# Altium project MCU.PrjPcb (part 3 of 3)

## Sheet SoC POWER SUPPLY.SchDoc
size A3; SheetNumber: 18; SheetTotal: 17
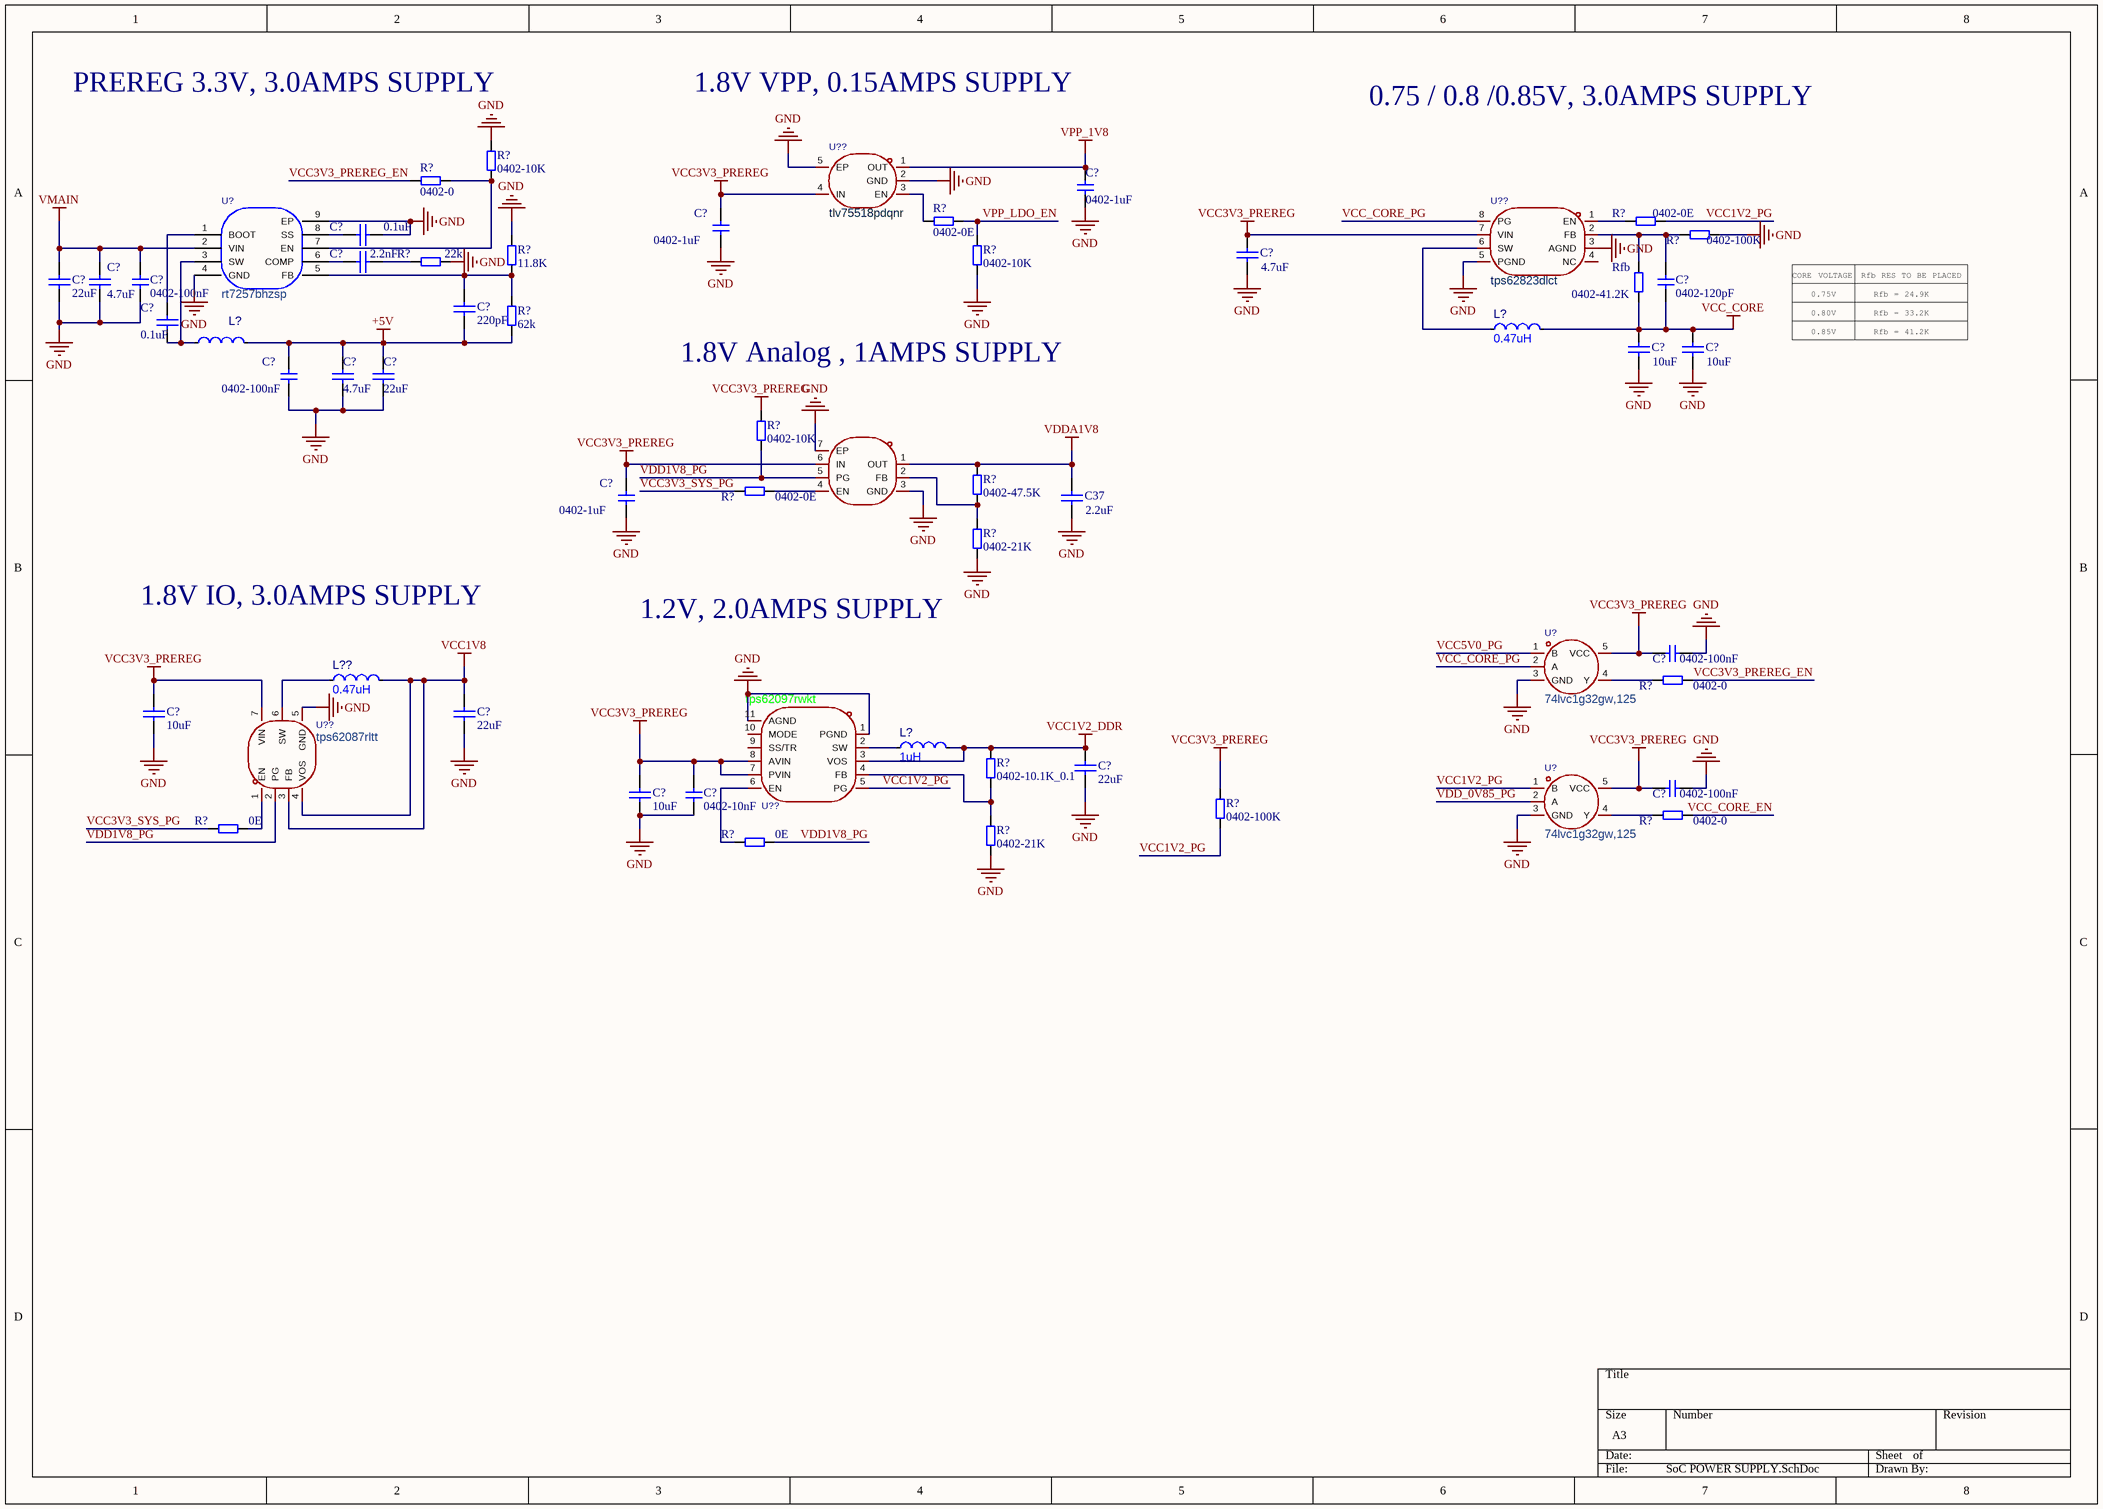
[diagram p13: SoC POWER SUPPLY.SchDoc]

### Parts
(Parts that share a designator on the sheet are numbered #1, #2 ... from top to bottom, then left to right.)
C37#2  2.2uF  [C0603]
C?#75  0402-1uF  [C0402]
C?#76  0.1uF  [C0603]
C?#77  0402-1uF  [C0402]
C?#78  2.2nF  [C0603]
C?#79  4.7uF  [C0603]
C?#80  0402-100nF  [C0402]
C?#81  0402-120pF  [C0402]
C?#82  22uF  [C0805]
C?#83  4.7uF  [C0603]
C?#84  220pF  [C0603]
C?#85  0.1uF  [C0603]
C?#86  10uF  [C0603]
C?#87  10uF  [C0603]
C?#88  0402-100nF  [C0402]
C?#89  4.7uF  [C0805]
C?#90  22uF  [C0805]
C?#91  0402-1uF  [C0402]
C?#92  0402-100nF  [C0402]
C?#93  10uF  [C0603]
C?#94  22uF  [C0805]
C?#95  22uF  [C0805]
C?#96  0402-100nF  [C0402]
C?#97  0402-10nF  [C0402]
C?#98  10uF  [C0603]
L?#3  0.47uH  [L0603]
L?#4  fxl0630-100-m  [IND-SMD_L7.3-W6.8]  (value not drawn)
L?#5  1uH  [L0603]
L??#2  0.47uH  [L0603]
R?#132  0402-0  [R0402]
R?#133  0402-10K  [R0402]
R?#134  0402-0E  [R0402]
R?#135  0402-0E  [R0402]
R?#136  0402-100K  [R0402]
R?#137  22k  [R0603]
R?#138  11.8K  [R0603]
R?#139  0402-10K  [R0402]
R?#140  62k  [R0603]
R?#141  0402-10K  [R0402]
R?#142  0402-0E  [R0402]
R?#143  0402-47.5K  [R0402]
R?#144  0402-21K  [R0402]
R?#145  0402-0  [R0402]
R?#146  0402-10.1K_0.1  [R0402]
R?#147  0402-0  [R0402]
R?#148  0E  [R0402]
R?#149  0402-100K  [R0402]
R?#150  0E  [R0402]
R?#151  0402-21K  [R0402]
Rfb  0402-41.2K  [R0402]
U?#8  rt7257bhzsp  [SOIC-8_L4.9-W3.9-P1.27-LS6.0-BL-EP2.3]
U?#9  74lvc1g32gw,125  [SOT-353_L2.2-W1.4-P0.65-LS2.4-BR]
U?#10  74lvc1g32gw,125  [SOT-353_L2.2-W1.4-P0.65-LS2.4-BR]
U??#6  tlv75518pdqnr  [X2SON-4_L1.0-W1.0-P0.65-TL-EP]
U??#7  tps62823dlct  [VSON-8_L2.0-W1.5-P0.50-BL]
U??#8  tps74601pdrvr  [WSON-6_L2.0-W2.0-P0.65-BL-EP]  (value not drawn)
U??#9  tps62087rltt  [VQFN-7_L2.0-W2.0-P0.50-TL_RLT0007A]
U??#10  tps62097rwkt  [VQFN-11_L2.0-W2.0-P0.50-TL_TI_RWK]

### Nets
+5V: C?#84.1 C?#88.1 C?#89.2 C?#90.2 L?#4.2 R?#140.1
GND: C37#2.1 C?#75.2 C?#76.1 C?#77.2 C?#79.1 C?#80.1 C?#80.2 C?#82.1 C?#82.2 C?#83.1 C?#83.2 C?#86.1 C?#87.1 C?#88.2 C?#89.1 C?#90.1 C?#91.2 C?#92.2 C?#93.1 C?#94.1 C?#95.1 C?#96.2 C?#97.2 C?#98.1 R?#133.2 R?#136.1 R?#137.2 R?#138.2 R?#139.1 R?#144.1 R?#151.1 U?#8.2(VIN) U?#8.4(GND) U?#8.9(EP) U?#9.3(GND) U?#10.3(GND) U??#6.2(GND) U??#6.5(EP) U??#7.3(AGND) U??#7.5(PGND) U??#8.3(GND) U??#8.7(EP) U??#9.5(GND) U??#10.1(PGND) U??#10.11(AGND)  [also labelled VMAIN]
VCC1V2_DDR: C?#95.2 L?#5.2 R?#146.2 U??#10.3(VOS)
VCC1V8: C?#94.2 L??#2.2 U??#9.3(FB) U??#9.4(VOS)
VCC3V3_PREREG: C?#77.1 C?#79.2 C?#91.1 C?#92.1 C?#93.2 C?#96.1 C?#97.1 C?#98.2 R?#141.2 R?#149.2 U?#9.5(VCC) U?#10.5(VCC) U??#6.4(IN) U??#7.7(VIN) U??#8.6(IN) U??#9.7(VIN) U??#10.7(PVIN) U??#10.8(AVIN)
VCC_CORE: C?#81.2 C?#86.2 C?#87.2 L?#3.2 Rfb.1
VDDA1V8: C37#2.2 R?#143.2 U??#8.1(OUT)
VPP_1V8: C?#75.1 U??#6.1(OUT)
VCC1V2_PG: R?#135.2 R?#149.1 U?#10.1(B) U??#10.5(PG)
VCC3V3_PREREG_EN: R?#132.2 R?#145.1
VCC3V3_SYS_PG: R?#142.2 R?#148.2
VCC5V0_PG: U?#9.1(B)
VCC_CORE_EN: R?#147.1
VCC_CORE_PG: U?#9.2(A) U??#7.8(PG)
VDD1V8_PG: R?#141.1 R?#150.1 U??#8.5(PG) U??#9.2(PG)
VDD_0V85_PG: U?#10.2(A)
VPP_LDO_EN: R?#134.2 R?#139.2
NetC?#76_2: C?#76.2 U?#8.8(SS)
NetC?#78_1: C?#78.1 R?#137.1
NetC?#78_2: C?#78.2 U?#8.6(COMP)
NetC?#81_1: C?#81.1 R?#136.2 Rfb.2 U??#7.2(FB)
NetC?#84_2: C?#84.2 R?#138.1 R?#140.2 U?#8.5(FB)
NetC?#85_1: C?#85.1 L?#4.1 U?#8.3(SW)
NetC?#85_2: C?#85.2 U?#8.1(BOOT)
NetL?#3_1: L?#3.1 U??#7.6(SW)
NetL?#5_1: L?#5.1 U??#10.2(SW)
NetL??#2_1: L??#2.1 U??#9.6(SW)
NetR?#132_1: R?#132.1 R?#133.1 U?#8.7(EN)
NetR?#134_1: R?#134.1 U??#6.3(EN)
NetR?#135_1: R?#135.1 U??#7.1(EN)
NetR?#142_1: R?#142.1 U??#8.4(EN)
NetR?#143_1: R?#143.1 R?#144.2 U??#8.2(FB)
NetR?#145_2: R?#145.2 U?#9.4(Y)
NetR?#146_1: R?#146.1 R?#151.2 U??#10.4(FB)
NetR?#147_2: R?#147.2 U?#10.4(Y)
NetR?#148_1: R?#148.1 U??#9.1(EN)
NetR?#150_2: R?#150.2 U??#10.6(EN)

Not connected (* = marked no-connect by the designer): U??#7 4(NC); U??#10 9(SS/TR) 10(MODE)

### Notes on the sheet
- PREREG 3.3V, 3.0AMPS SUPPLY
- 1.8V VPP, 0.15AMPS SUPPLY
- 0.75 / 0.8 /0.85V, 3.0AMPS SUPPLY
- (near R?#141) 1.8V Analog , 1AMPS SUPPLY
- 1.8V IO, 3.0AMPS SUPPLY
- 1.2V, 2.0AMPS SUPPLY

### Library data of the parts
C37#2 C?#79 C?#86 C?#87 = C0603_1: Capacitor; Value: 104; Published: 8-Jun-2000; LatestRevisionDate: 17-Jul-2002; LatestRevisionNote: Re-released for DXP Platform.; Publisher: Altium Limited
C?#75 C?#77 C?#80 C?#81 C?#88 C?#91 C?#92 C?#96 C?#97 = C0402: 物料号: *; 物料描述: *
C?#76 C?#78 C?#83-C?#85 C?#93 C?#98 = C0603: Capacitor; Value: 104; Published: 8-Jun-2000; LatestRevisionDate: 17-Jul-2002; LatestRevisionNote: Re-released for DXP Platform.; Publisher: Altium Limited
C?#82 C?#89 C?#90 C?#94 C?#95 = C0805: Capacitor; Value: 104; Published: 8-Jun-2000; LatestRevisionDate: 17-Jul-2002; LatestRevisionNote: Re-released for DXP Platform.; Publisher: Altium Limited
L?#3 L??#2 = L0603: 小型化一体成型T-CORE，小体积，扁线工艺，感值小，0.47uH ±20% 8.6A 1008​ PCT252012-R47-M; Manufacturer: Sunlord(顺络); Symbol: SDFL1608S100KTF; AddInBom: yes; ModelId: 2bc5ec593d464d6ba9807aec0b5673c2; ModelName: L0603_L1.6-W0.8-H0.5_BEAD; ModelTransform: 62.992,31.496,0,180,0,0,0.094,0.629,0; Value: 10uH; Tolerance: ±10%; Current Rating: 3mA; DC Resistance(DCR): 1.85Ω; Q @ Frequency: 30@2MHz; Frequency - Self Resonant: 17MHz; LCSC Part Name: 10uH ±10%; SupplierPart: C1035; ManufacturerPart: SDFL1608S100KTF; Supplier Footprint: 0603; JLCPCB Part Class: Basic Part; Datasheet: https://item.szlcsc.com/datasheet/SDFL1608S100KTF/1387.html; Supplier: LCSC; ConvertToPcb: yes; FootprintName: L0603; Current - Saturation (Isat): -; Ratings: -
L?#4 = fxl0630-100-m: 电感值:6.8uH;精度:±20%;额定电流:4.5A;饱和电流(Isat):5.5A;类型:一体成型电感;; Manufacturer: cjiang(长江微电); AddInBom: yes; ModelId: e28854526ca747668ea12fbe1dd39a63; ModelName: IND-SMD_L7.3-W6.8-H3.0; ModelTransform: 292.125,267.716,0,0,0,0,0,0,0; Value: 10uH; Tolerance: ±20%; Current Rating: 4.5A; Current - Saturation(Isat): 5.5A; DC Resistance(DCR): 68mΩ; Type: 一体成型电感; Symbol: FXL0630-100-M; LCSC Part Name: 10uH ±20% 5.5A; SupplierPart: C167223; ManufacturerPart: FXL0630-100-M; Supplier Footprint: SMD,7x6.6mm; JLCPCB Part Class: Extended Part; Datasheet: https://item.szlcsc.com/datasheet/FXL0630-100-M/178606.html; Supplier: LCSC; ConvertToPcb: yes; FootprintName: IND-SMD_L7.3-W6.8; Ratings: -
L?#5 = L0603: 小型化一体成型T-CORE，小体积，扁线工艺，感值小，1210​ 1uH ±20% 6A PCT322510-1R0-M; Manufacturer: Sunlord(顺络); Symbol: SDFL1608S100KTF; AddInBom: yes; ModelId: 2bc5ec593d464d6ba9807aec0b5673c2; ModelName: L0603_L1.6-W0.8-H0.5_BEAD; ModelTransform: 62.992,31.496,0,180,0,0,0.094,0.629,0; Value: 10uH; Tolerance: ±10%; Current Rating: 3mA; DC Resistance(DCR): 1.85Ω; Q @ Frequency: 30@2MHz; Frequency - Self Resonant: 17MHz; LCSC Part Name: 10uH ±10%; SupplierPart: C1035; ManufacturerPart: SDFL1608S100KTF; Supplier Footprint: 0603; JLCPCB Part Class: Basic Part; Datasheet: https://item.szlcsc.com/datasheet/SDFL1608S100KTF/1387.html; Supplier: LCSC; ConvertToPcb: yes; FootprintName: L0603; Current - Saturation (Isat): -; Ratings: -
R?#132-R?#136 R?#139 R?#141-R?#151 Rfb = R0402: 片式电阻; 物料描述: 片式电阻器-0805-10KΩ-5%-JT; 物料号: NA
R?#137 R?#138 R?#140 = 0603-3KΩ-5%: 片式电阻; 物料描述: 片式电阻器-0805-10KΩ-5%-JT; 物料号: NA
U?#8 = rt7257bhzsp: 功能类型:降压型;工作电压:4.5V~18V;输出电压:800mV~12V;输出电流:3A;输出类型:可调;; Manufacturer: RICHTEK(立锜); AddInBom: yes; ModelId: ba240e69e1f440f79b85bd6e5ae1d4fa; ModelTransform: 192.913,236.22,0,0,0,0,0,0,0; Function: 降压型; Output Current: 3A; Frequency - Switching: 1.2MHz; Synchronous Rectifier: 是; Number of Outputs: 1; Topology: 降压式; Quiescent Current: 800uA; Switch tube (built-in/external): 内置; Output Type: 可调; Symbol: RT7257BHZSP; LCSC Part Name: 降压型 3A 4.5V~18V; SupplierPart: C27998; ManufacturerPart: RT7257BHZSP; Supplier Footprint: SOIC-8-EP; JLCPCB Part Class: Extended Part; Datasheet: https://item.szlcsc.com/datasheet/RT7257BHZSP/28748.html; Supplier: LCSC; ConvertToPcb: yes; FootprintName: SOIC-8_L4.9-W3.9-P1.27-LS6.0-BL-EP2.3; ModelName: SOIC-8_L4.9-W3.9-P1.27-LS6.0-BL-EP2.3; Voltage - Supply: 4.5V~18V; Output Voltage: 800mV~12V; Operating Temperature: -40℃~+125℃@(TJ); Features: 外部补偿；逐波限流；可调软启动；过流保护；负载断开；打嗝限流；保护锁死
U?#9 U?#10 = 74lvc1g32gw,125: 逻辑类型:或门;门电路数量:1;工作电压:1.65V~5.5V;静态电流(Iq):4uA;传播延迟(tpd):4ns@5V,50pF;; Manufacturer: Nexperia(安世); AddInBom: yes; ModelId: 4e853f80e521480faffa12d625b9ef27; ModelName: SOT-353-5P_L2.0-W1.3-H1.1-LS2.0-P0.65; ModelTransform: 83.17133,78.74,0,180,0,0,0,0,0; Logic Type: 或门; Number of Gates: 1; Quiescent Current: 4uA; Current - Output Low(IOL): 32mA; Input Logic Level - High: 1.7V~2V; Input Logic Level - Low: 700mV~800mV; Output Logic Level - High: 3.4V；2V; Output Logic Level - Low: 800mV; Inputs per Gates: 2; Input type: 施密特触发器; Symbol: 74LVC1G32GW,125; LCSC Part Name: 单路二输入或门; SupplierPart: C12516; ManufacturerPart: 74LVC1G32GW,125; Supplier Footprint: SOT-353; JLCPCB Part Class: Extended Part; Datasheet: https://item.szlcsc.com/datasheet/74LVC1G32GW%252C125/13150.html; Supplier: LCSC; ConvertToPcb: yes; FootprintName: SOT-353_L2.2-W1.4-P0.65-LS2.4-BR; Voltage - Supply: 1.65V~5.5V; Current - Output High(IOH): 32mA; Series: 74LVC系列; Propagation Delay: 4ns@5V,50pF; Operating Temperature: -40℃~+125℃; Features: 局部关断模式；过压容忍输入; output type: -
U??#6 = tlv75518pdqnr: 输出极性:正极;工作电压:5.5V;输出电压:1.8V;输出电流:500mA;电源纹波抑制比(PSRR):46dB@(100kHz);输出类型:固定;; Manufacturer: TI(德州仪器); AddInBom: yes; ModelId: a553ba60275546fca9968967ae1dc97f; ModelName: X2SON-4_L1.0-W1.0-H0.4-P0.65-TL-EPSLDPRT; ModelTransform: 40.1574,40.1574,0,90,0,0,-0.001,-0.001,0; Output Configuration: 正极; Voltage - Supply: 5.5V; Output Voltage: 1.8V; Output Current: 500mA; Voltage Dropout: 238mV@(500mA); standby current: 33uA; Noise: 71.5uVrms; Output Type: 固定; Number of Outputs: 1; Symbol: TLV75518PDQNR; LCSC Part Name: 1.8V 500mA 5.5V; SupplierPart: C2867154; ManufacturerPart: TLV75518PDQNR; Supplier Footprint: X2-SON-4-EP(1x1); JLCPCB Part Class: Extended Part; Datasheet: https://www.ti.com/cn/lit/ds/symlink/tlv755p.pdf; Supplier: LCSC; ConvertToPcb: yes; FootprintName: X2SON-4_L1.0-W1.0-P0.65-TL-EP; Power Supply Rejection Ratio (PSRR): 46dB@(100kHz); Features: 内置软启动；使能控制；短路保护；过流保护；输出放电；热关断；输入欠压保护; Operating Temperature: -40℃~+125℃@(Tj)
U??#7 = tps62823dlct: 功能类型:降压型;工作电压:2.4V~5.5V;输出电压:600mV~4V;输出电流:3A;输出类型:可调;; Manufacturer: TI(德州仪器); AddInBom: yes; ModelId: 875e547f9a24421682681603838b91fb; ModelName: VSON-8_L2.0-W1.5-H1.0-P0.50-BL; ModelTransform: 59.8424,78.74,0,270,0,0,0,0,0; Function: 降压型; Output Current: 3A; Frequency - Switching: 2.2MHz; Synchronous Rectifier: 是; Number of Outputs: 1; Topology: 降压式; Quiescent Current: 4uA; Switch tube (built-in/external): 内置; Output Type: 可调; Symbol: TPS62823DLCT; LCSC Part Name: 降压型 3A 2.4V~5.5V; SupplierPart: C2072030; ManufacturerPart: TPS62823DLCT; Supplier Footprint: VSON-8(1.5x2); JLCPCB Part Class: Extended Part; Datasheet: https://www.ti.com/cn/lit/ds/symlink/tps62821.pdf; Supplier: LCSC; ConvertToPcb: yes; FootprintName: VSON-8_L2.0-W1.5-P0.50-BL; Voltage - Supply: 2.4V~5.5V; Output Voltage: 600mV~4V; Operating Temperature: -40℃~+125℃@(TJ); Features: 轻载高效模式；逐波限流；过流保护；输出放电；工作状态指示；打嗝限流
U??#8 = tps74601pdrvr: 输出极性:正极;工作电压:6V;输出电压:550mV~5.5V;输出电流:1A;电源纹波抑制比(PSRR):50dB@(1kHz);输出类型:可调;; Manufacturer: TI(德州仪器); AddInBom: yes; ModelId: 521c6d8f59ad4736925338f4a59f8ef4; ModelName: WSON-6_L2.0-W2.0-H0.8-P0.65; ModelTransform: 79.527,78.74,0,90,0,0,-0.002,-0.002,0; Output Configuration: 正极; Voltage - Supply: 6V; Output Current: 1A; Voltage Dropout: 225mV@(1A); standby current: 25uA; Noise: 53uVrms; Output Type: 可调; Number of Outputs: 1; Symbol: TPS74601PDRVR; LCSC Part Name: 550mV~5.5V 1A 6V; SupplierPart: C2837407; ManufacturerPart: TPS74601PDRVR; Supplier Footprint: WSON-6-EP(2x2); JLCPCB Part Class: Extended Part; Datasheet: https://www.ti.com/cn/lit/ds/symlink/tps746.pdf; Supplier: LCSC; ConvertToPcb: yes; FootprintName: WSON-6_L2.0-W2.0-P0.65-BL-EP; Output Voltage: 550mV~5.5V; Power Supply Rejection Ratio (PSRR): 50dB@(1kHz); Features: 内置软启动；工作状态指示；输入欠压保护；使能控制；过流保护；短路保护；输出放电；热关断; Operating Temperature: -40℃~+125℃@(Tj)
U??#9 = tps62087rltt: 功能类型:降压型;工作电压:2.5V~6V;输出电压:1.8V;输出电流:3A;输出类型:固定;; Manufacturer: TI(德州仪器); AddInBom: yes; ModelId: 82205d4ef1774f108fb3b3b48b26804a; ModelTransform: 78.819,78.74,0,0,0,0,8.501,-0.001,0; Function: 降压型; Output Voltage: 1.8V; Output Current: 3A; Frequency - Switching: 2.4MHz; Synchronous Rectifier: 是; Number of Outputs: 1; Topology: 降压式; Quiescent Current: 17uA; Switch tube (built-in/external): 内置; Output Type: 固定; Symbol: TPS62087RLTT; LCSC Part Name: 降压型 3A 2.5V~6V; SupplierPart: C2071697; ManufacturerPart: TPS62087RLTT; Supplier Footprint: VQFN-7(2x2); JLCPCB Part Class: Extended Part; Datasheet: https://www.ti.com/cn/lit/gpn/tps62086; Supplier: LCSC; ConvertToPcb: yes; FootprintName: VQFN-7_L2.0-W2.0-P0.50-TL_RLT0007A; ModelName: VQFN-7_L2.0-W2.0-P0.50-TL_RLT0007A; Voltage - Supply: 2.5V~6V; Operating Temperature: -40℃~+125℃@(TJ); Features: 轻载高效模式；输出放电；工作状态指示；打嗝限流
U??#10 = tps62097rwkt: 功能类型:降压型;工作电压:2.5V~6V;输出电压:800mV~6V;输出电流:2A;输出类型:可调;; Manufacturer: TI(德州仪器); AddInBom: yes; Function: 降压型; Output Current: 2A; Frequency - Switching: 2.5MHz; Synchronous Rectifier: 是; Number of Outputs: 1; Topology: 降压式; Quiescent Current: 57uA; Switch tube (built-in/external): 内置; Output Type: 可调; Symbol: TPS62097RWKT; LCSC Part Name: 降压型 2A 2.5V~6V; SupplierPart: C2073254; ManufacturerPart: TPS62097RWKT; Supplier Footprint: VQFN-11(2x2); JLCPCB Part Class: Extended Part; Datasheet: https://www.ti.com/cn/lit/gpn/tps62097; Supplier: LCSC; ConvertToPcb: yes; FootprintName: VQFN-11_L2.0-W2.0-P0.50-TL_TI_RWK; Voltage - Supply: 2.5V~6V; Output Voltage: 800mV~6V; Operating Temperature: -40℃~+125℃@(TJ); Features: 轻载高效模式；可调软启动；输出放电；输出电压跟随；工作状态指示；打嗝限流

## Sheet PERIPHERAL POWER SUPPLY.SchDoc
size A3; SheetNumber: 16; SheetTotal: 17
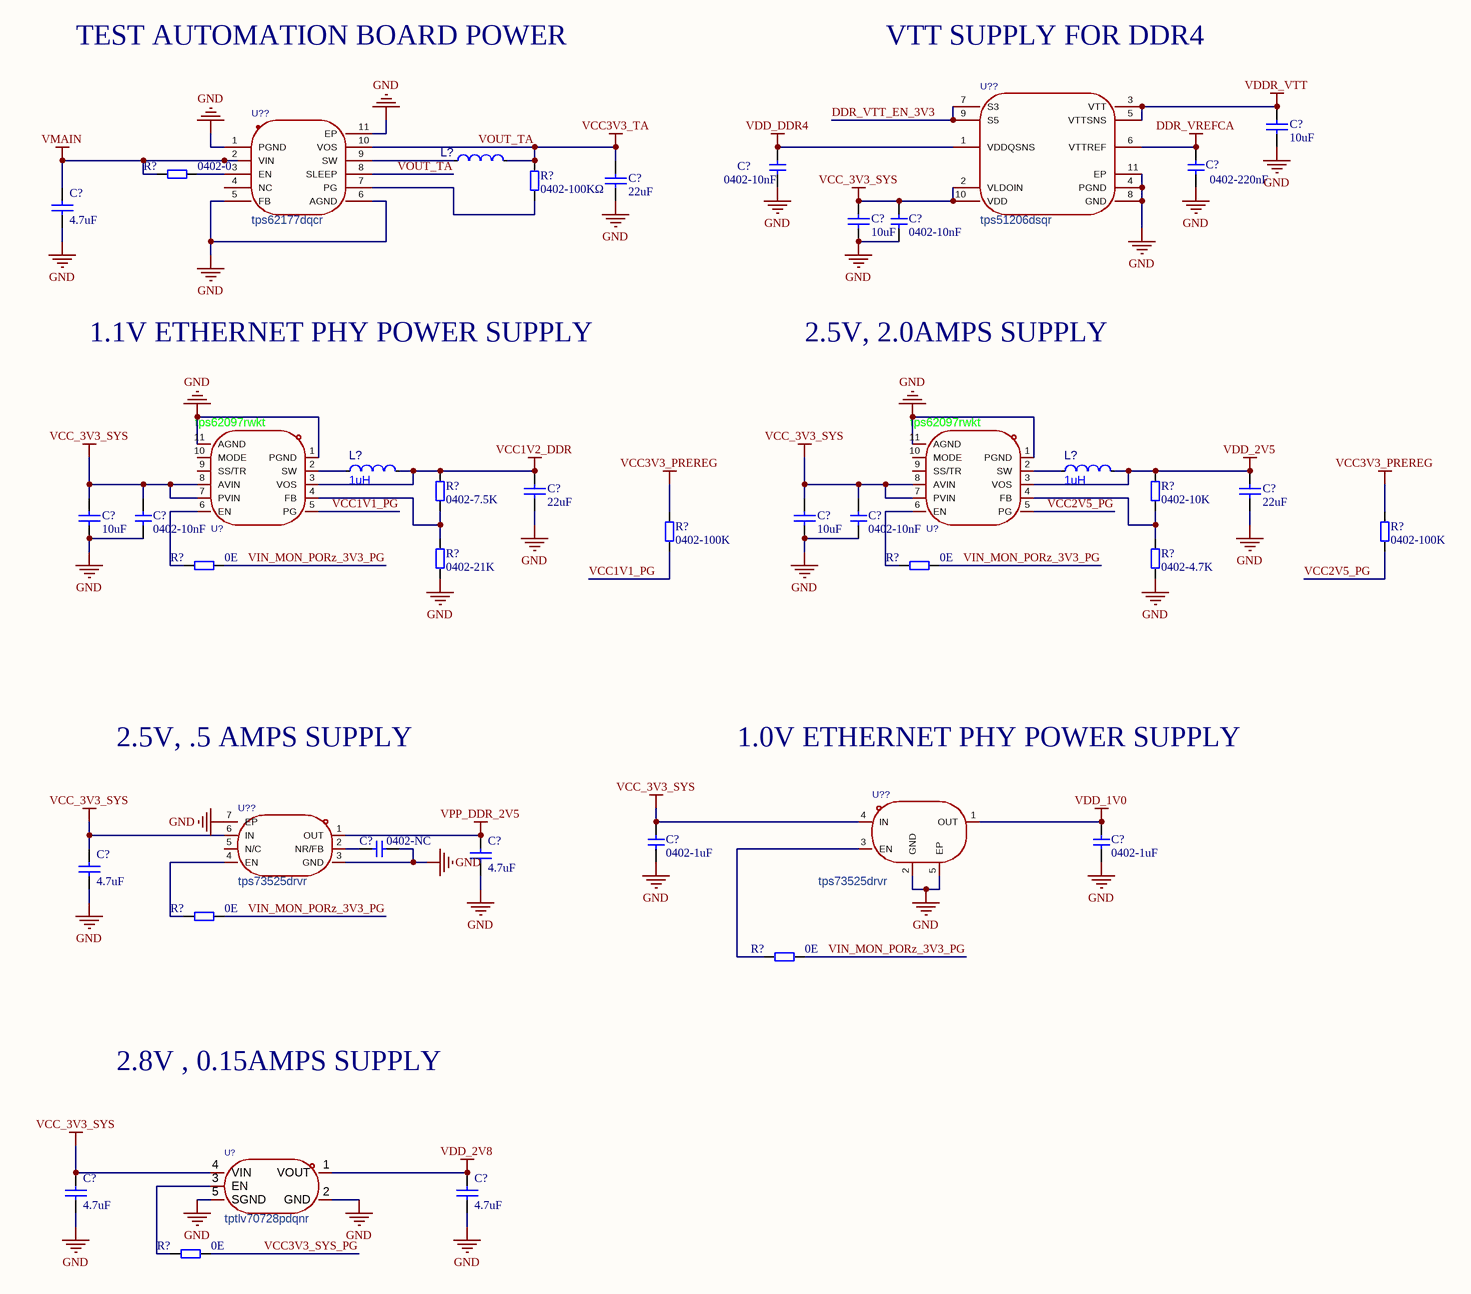
[diagram p14: PERIPHERAL POWER SUPPLY.SchDoc]

### Parts
(Parts that share a designator on the sheet are numbered #1, #2 ... from top to bottom, then left to right.)
C?#99  10uF  [C0603]
C?#100  0402-10nF  [C0402]
C?#101  0402-220nF  [C0402]
C?#102  22uF  [C0805]
C?#103  4.7uF  [C0603]
C?#104  0402-10nF  [C0402]
C?#105  10uF  [C0603]
C?#106  22uF  [C0805]
C?#107  22uF  [C0805]
C?#108  0402-10nF  [C0402]
C?#109  0402-10nF  [C0402]
C?#110  10uF  [C0603]
C?#111  10uF  [C0603]
C?#112  0402-1uF  [C0402]
C?#113  0402-1uF  [C0402]
C?#114  0402-NC  [C0402]
C?#115  4.7uF  [C0603]
C?#116  4.7uF  [C0603]
C?#117  4.7uF  [C0603]
C?#118  4.7uF  [C0603]
L?#6  fxl0630-100-m  [IND-SMD_L7.3-W6.8]  (value not drawn)
L?#7  1uH  [L0603]
L?#8  1uH  [L0603]
R?#152  0402-0  [R0402]
R?#153  0402-100KΩ  [R0402]
R?#154  0402-7.5K  [R0402]
R?#155  0402-10K  [R0402]
R?#156  0402-100K  [R0402]
R?#157  0402-100K  [R0402]
R?#158  0E  [R0402]
R?#159  0E  [R0402]
R?#160  0402-21K  [R0402]
R?#161  0402-4.7K  [R0402]
R?#162  0E  [R0402]
R?#163  0E  [R0402]
R?#164  0E  [R0402]
U?#11  tps62097rwkt  [VQFN-11_L2.0-W2.0-P0.50-TL_TI_RWK]
U?#12  tps62097rwkt  [VQFN-11_L2.0-W2.0-P0.50-TL_TI_RWK]
U?#13  tptlv70728pdqnr  [UDFN-4_L1.0-W1.0-P0.65-TL]
U??#11  tps51206dsqr  [SON-10_L2.0-W2.0-P0.40-TL-EP]
U??#12  tps62177dqcr  [WSON-10_L3.0-W2.0-P0.50-BL-EP]
U??#13  tps73525drvr  [WSON-6_L2.0-W2.0-P0.65-TL-EP]
U??#14  tps73525drvr  [WSON-6_L2.0-W2.0-P0.65-TL-EP]

### Nets
DDR_VREFCA: C?#101.1 U??#11.6(VTTREF)
GND: C?#99.1 C?#100.2 C?#101.2 C?#102.1 C?#103.1 C?#103.2 C?#104.2 C?#105.1 C?#106.1 C?#107.1 C?#108.2 C?#109.2 C?#110.1 C?#111.1 C?#112.2 C?#113.2 C?#114.2 C?#115.1 C?#116.1 C?#117.1 C?#118.1 R?#152.1 R?#160.1 R?#161.1 U?#11.1(PGND) U?#11.11(AGND) U?#12.1(PGND) U?#12.11(AGND) U?#13.2(GND) U?#13.5(SGND) U??#11.4(PGND) U??#11.8(GND) U??#11.11(EP) U??#12.1(PGND) U??#12.2(VIN) U??#12.5(FB) U??#12.6(AGND) U??#12.11(EP) U??#13.2(GND) U??#13.5(EP) U??#14.3(GND) U??#14.7(EP)  [also labelled VMAIN]
VCC1V2_DDR: C?#106.2 L?#7.2 R?#154.2 U?#11.3(VOS)
VCC3V3_PREREG: R?#156.2 R?#157.2
VCC_3V3_SYS: C?#104.1 C?#105.2 C?#108.1 C?#109.1 C?#110.2 C?#111.2 C?#112.1 C?#116.2 C?#117.2 U?#11.7(PVIN) U?#11.8(AVIN) U?#12.7(PVIN) U?#12.8(AVIN) U?#13.4(VIN) U??#11.2(VLDOIN) U??#11.10(VDD) U??#13.4(IN) U??#14.6(IN)
VDD_1V0: C?#113.1 U??#13.1(OUT)
VDD_2V5: C?#107.2 L?#8.2 R?#155.2 U?#12.3(VOS)
VDD_2V8: C?#118.2 U?#13.1(VOUT)
VDD_DDR4: C?#100.1 U??#11.1(VDDQSNS)
VDDR_VTT: C?#99.2 U??#11.3(VTT) U??#11.5(VTTSNS)
VOUT_TA: C?#102.2 L?#6.2 R?#153.2 U??#12.8(SLEEP) U??#12.10(VOS)  [also labelled VCC3V3_TA]
VPP_DDR_2V5: C?#115.2 U??#14.1(OUT)
DDR_VTT_EN_3V3: U??#11.7(S3) U??#11.9(S5)
VCC1V1_PG: R?#156.1 U?#11.5(PG)
VCC2V5_PG: R?#157.1 U?#12.5(PG)
VCC3V3_SYS_PG: R?#164.1
VIN_MON_PORz_3V3_PG: R?#158.1 R?#159.1 R?#162.1 R?#163.1
NetC?#114_1: C?#114.1 U??#14.2(NR/FB)
NetL?#6_1: L?#6.1 U??#12.9(SW)
NetL?#7_1: L?#7.1 U?#11.2(SW)
NetL?#8_1: L?#8.1 U?#12.2(SW)
NetR?#152_2: R?#152.2 U??#12.3(EN)
NetR?#153_1: R?#153.1 U??#12.7(PG)
NetR?#154_1: R?#154.1 R?#160.2 U?#11.4(FB)
NetR?#155_1: R?#155.1 R?#161.2 U?#12.4(FB)
NetR?#158_2: R?#158.2 U?#11.6(EN)
NetR?#159_2: R?#159.2 U?#12.6(EN)
NetR?#162_2: R?#162.2 U??#14.4(EN)
NetR?#163_2: R?#163.2 U??#13.3(EN)
NetR?#164_2: R?#164.2 U?#13.3(EN)

Not connected (* = marked no-connect by the designer): U?#11 9(SS/TR) 10(MODE); U?#12 9(SS/TR) 10(MODE); U??#12 4(NC); U??#14 5(N/C)

### Notes on the sheet
- TEST AUTOMATION BOARD POWER
- VTT SUPPLY FOR DDR4
- 1.1V ETHERNET PHY POWER SUPPLY
- 2.5V, 2.0AMPS SUPPLY
- 2.5V, .5 AMPS SUPPLY
- 1.0V ETHERNET PHY POWER SUPPLY
- 2.8V , 0.15AMPS SUPPLY

### Library data of the parts
C?#99 C?#103 C?#105 C?#110 C?#111 C?#115-C?#118 = C0603: Capacitor; Value: 104; Published: 8-Jun-2000; LatestRevisionDate: 17-Jul-2002; LatestRevisionNote: Re-released for DXP Platform.; Publisher: Altium Limited
C?#100 C?#101 C?#104 C?#108 C?#109 C?#112-C?#114 = C0402: 物料号: *; 物料描述: *
C?#102 C?#106 C?#107 = C0805: Capacitor; Value: 104; Published: 8-Jun-2000; LatestRevisionDate: 17-Jul-2002; LatestRevisionNote: Re-released for DXP Platform.; Publisher: Altium Limited
L?#6 = fxl0630-100-m: as L?#4 on sheet SoC POWER SUPPLY; Symbol: FXL0630-100-M; LCSC Part Name: 10uH ±20% 5.5A; SupplierPart: C167223; ManufacturerPart: FXL0630-100-M; Supplier Footprint: SMD,7x6.6mm; JLCPCB Part Class: Extended Part; Datasheet: https://item.szlcsc.com/datasheet/FXL0630-100-M/178606.html; Supplier: LCSC; ConvertToPcb: yes; FootprintName: IND-SMD_L7.3-W6.8; Ratings: -
L?#7 L?#8 = L0603: as L?#5 on sheet SoC POWER SUPPLY; LCSC Part Name: 10uH ±10%; SupplierPart: C1035; ManufacturerPart: SDFL1608S100KTF; Supplier Footprint: 0603; JLCPCB Part Class: Basic Part; Datasheet: https://item.szlcsc.com/datasheet/SDFL1608S100KTF/1387.html; Supplier: LCSC; ConvertToPcb: yes; FootprintName: L0603; Current - Saturation (Isat): -; Ratings: -
R?#152-R?#164 = R0402: as R?#132 on sheet SoC POWER SUPPLY
U?#11 U?#12 = tps62097rwkt: as U??#10 on sheet SoC POWER SUPPLY; Symbol: TPS62097RWKT; LCSC Part Name: 降压型 2A 2.5V~6V; SupplierPart: C2073254; ManufacturerPart: TPS62097RWKT; Supplier Footprint: VQFN-11(2x2); JLCPCB Part Class: Extended Part; Datasheet: https://www.ti.com/cn/lit/gpn/tps62097; Supplier: LCSC; ConvertToPcb: yes; FootprintName: VQFN-11_L2.0-W2.0-P0.50-TL_TI_RWK; Voltage - Supply: 2.5V~6V; Output Voltage: 800mV~6V; Operating Temperature: -40℃~+125℃@(TJ); Features: 轻载高效模式；可调软启动；输出放电；输出电压跟随；工作状态指示；打嗝限流
U?#13 = tptlv70728pdqnr: Manufacturer: TECH PUBLIC(台舟); AddInBom: yes; ModelId: 9c2eebc267f642aab45e7193d1ab7813; ModelTransform: 40.1574,39.37394,0,0,0,0,0,0,0; LCSC Part Name: TPTLV70728PDQNR; SupplierPart: C55191407; ManufacturerPart: TPTLV70728PDQNR; Supplier Footprint: DFN-4(1x1); JLCPCB Part Class: Extended Part; Datasheet: https://item.szlcsc.com/datasheet/TPTLV70728PDQNR/58985584.html; Supplier: LCSC; ConvertToPcb: yes; SymbolName: TPTLV70728PDQNR; FootprintName: UDFN-4_L1.0-W1.0-P0.65-TL; ModelName: UDFN-4_L1.0-W1.0-P0.65-TL
U??#11 = tps51206dsqr: 输出极性:正极;工作电压:6.5V;输出电压:500mV~900mV;输出电流:2A;电源纹波抑制比(PSRR):-;输出类型:-;; Manufacturer: TI(德州仪器); AddInBom: yes; ModelId: 67ee0328d4a549d7a6ffbda5a640ba02; ModelName: SON-10_L2.0-W2.0-H0.9-P0.40-TL-EP; ModelTransform: 78.74,79.527,0,270,0,0,0,0,0; Output Configuration: 正极; Voltage - Supply: 6.5V; Output Current: 2A; standby current: 170uA; Number of Outputs: 2; Symbol: TPS51206DSQR; LCSC Part Name: 500mV~900mV 2A 6.5V; SupplierPart: C88038; ManufacturerPart: TPS51206DSQR; Supplier Footprint: SON-10-EP(2x2); JLCPCB Part Class: Extended Part; Datasheet: https://www.ti.com/cn/lit/ds/symlink/tps51206.pdf; Supplier: LCSC; ConvertToPcb: yes; FootprintName: SON-10_L2.0-W2.0-P0.40-TL-EP; Output Voltage: 500mV~900mV; Power Supply Rejection Ratio (PSRR): -; Voltage Dropout: -; Noise: -; Features: 输入欠压保护；输出放电；热关断; Operating Temperature: -40℃~+85℃; Output Type: -
U??#12 = tps62177dqcr: 功能类型:降压型;工作电压:4.75V~28V;输出电压:3.3V;输出电流:500mA;输出类型:固定;; Manufacturer: TI(德州仪器); AddInBom: yes; ModelId: 31d7ab64162b448781b010e9f8706f97; ModelName: WSON-10_L3.0-W2.0-H0.8-P0.50; ModelTransform: 79.527,118.11,0,90,0,0,0,0,0; Function: 降压型; Output Voltage: 3.3V; Output Current: 500mA; Frequency - Switching: 1MHz; Synchronous Rectifier: 是; Number of Outputs: 1; Topology: 降压式; Quiescent Current: 22uA; Switch tube (built-in/external): 内置; Output Type: 固定; Symbol: TPS62177DQCR; LCSC Part Name: 降压型 500mA 4.75V~28V; SupplierPart: C91241; ManufacturerPart: TPS62177DQCR; Supplier Footprint: WSON-10-EP(2x3); JLCPCB Part Class: Extended Part; Datasheet: https://www.ti.com/cn/lit/ds/symlink/tps62177.pdf; Supplier: LCSC; ConvertToPcb: yes; FootprintName: WSON-10_L3.0-W2.0-P0.50-BL-EP; Voltage - Supply: 4.75V~28V; Operating Temperature: -40℃~+125℃@(TJ); Features: 轻载高效模式；过流保护；输出放电；工作状态指示
U??#13 = TLV70710DQNR: 输出极性:正极;工作电压:6.5V;输出电压:2.5V;输出电流:500mA;电源纹波抑制比(PSRR):68dB@(1kHz);输出类型:固定;; Manufacturer: TI(德州仪器); AddInBom: yes; ModelId: 521c6d8f59ad4736925338f4a59f8ef4; ModelName: WSON-6_L2.0-W2.0-H0.8-P0.65; ModelTransform: 79.527,78.74,0,0,0,0,0,0,0; Output Configuration: 正极; Voltage - Supply: 6.5V; Output Voltage: 2.5V; Output Current: 500mA; Voltage Dropout: 280mV@(500mA); standby current: 45uA; Noise: 13.2uVrms; Output Type: 固定; Number of Outputs: 1; Symbol: TPS73525DRVR; LCSC Part Name: 500mA 6.5V; SupplierPart: C2870409; ManufacturerPart: TPS73525DRVR; Supplier Footprint: WSON-6-EP(2x2); JLCPCB Part Class: Extended Part; Datasheet: https://www.ti.com/cn/lit/ds/symlink/tps735.pdf; Supplier: LCSC; ConvertToPcb: yes; FootprintName: WSON-6_L2.0-W2.0-P0.65-TL-EP; Power Supply Rejection Ratio (PSRR): 68dB@(1kHz); Features: 使能控制；输入欠压保护；噪声旁路端子；过流保护；热关断; Operating Temperature: -40℃~+125℃@(Tj)
U??#14 = tps73525drvr: 输出极性:正极;工作电压:6.5V;输出电压:2.5V;输出电流:500mA;电源纹波抑制比(PSRR):68dB@(1kHz);输出类型:固定;; Manufacturer: TI(德州仪器); AddInBom: yes; ModelId: 521c6d8f59ad4736925338f4a59f8ef4; ModelName: WSON-6_L2.0-W2.0-H0.8-P0.65; ModelTransform: 79.527,78.74,0,0,0,0,0,0,0; Output Configuration: 正极; Voltage - Supply: 6.5V; Output Voltage: 2.5V; Output Current: 500mA; Voltage Dropout: 280mV@(500mA); standby current: 45uA; Noise: 13.2uVrms; Output Type: 固定; Number of Outputs: 1; Symbol: TPS73525DRVR; LCSC Part Name: 500mA 6.5V; SupplierPart: C2870409; ManufacturerPart: TPS73525DRVR; Supplier Footprint: WSON-6-EP(2x2); JLCPCB Part Class: Extended Part; Datasheet: https://www.ti.com/cn/lit/ds/symlink/tps735.pdf; Supplier: LCSC; ConvertToPcb: yes; FootprintName: WSON-6_L2.0-W2.0-P0.65-TL-EP; Power Supply Rejection Ratio (PSRR): 68dB@(1kHz); Features: 使能控制；输入欠压保护；噪声旁路端子；过流保护；热关断; Operating Temperature: -40℃~+125℃@(Tj)

## Sheet VCC3V3_SYS & VCC_5V0 POWER SUPPLY.SchDoc: AM2434 - 3V3 / 5V main supplies
size A4; Date: 2026-10-16; Revision: PWR-A; SheetNumber: 16; SheetTotal: 17
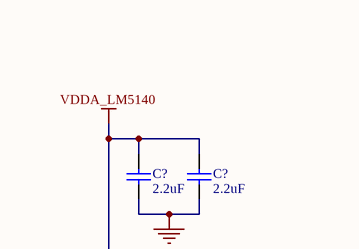
[diagram p15: VCC3V3_SYS & VCC_5V0 POWER SUPPLY.SchDoc, top left]
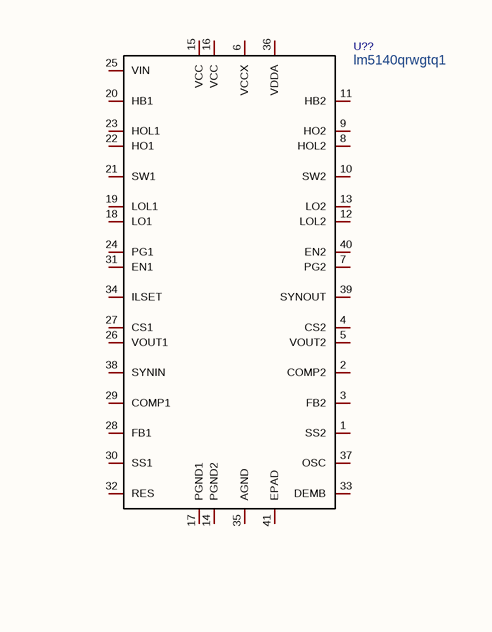
[diagram p16: VCC3V3_SYS & VCC_5V0 POWER SUPPLY.SchDoc, top right]
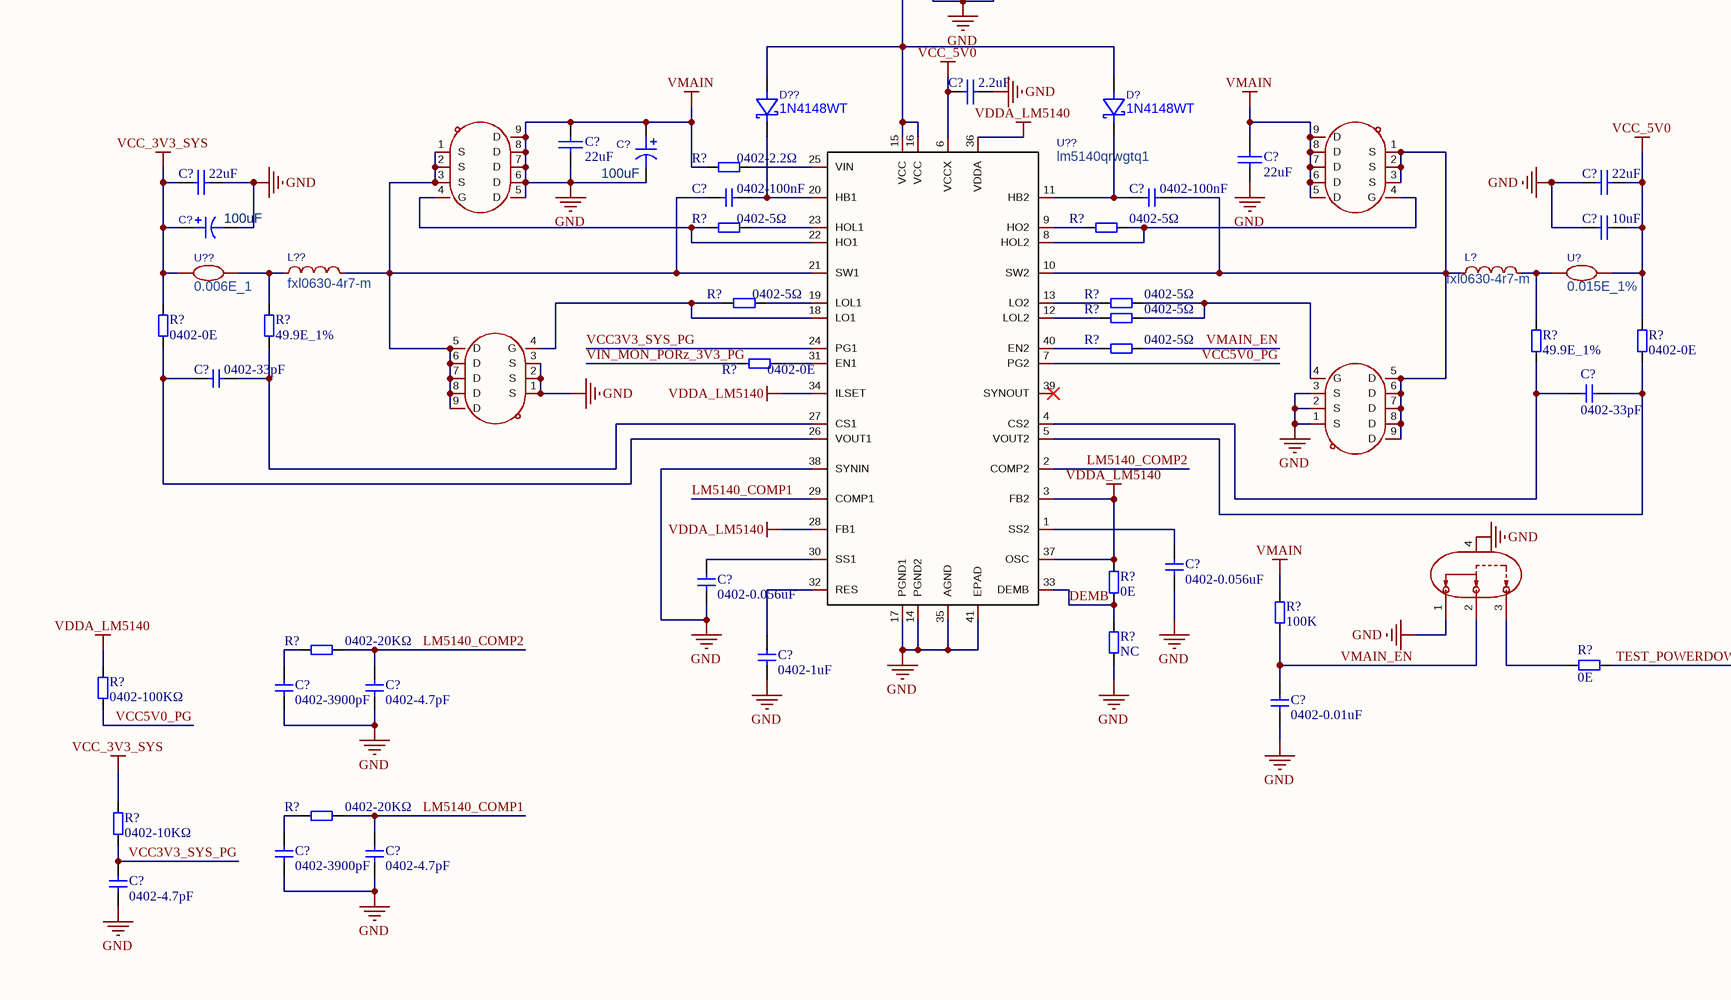
[diagram p17: VCC3V3_SYS & VCC_5V0 POWER SUPPLY.SchDoc, bottom left]
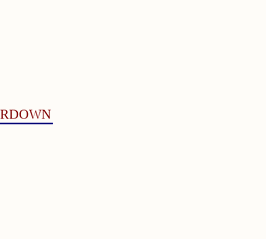
[diagram p18: VCC3V3_SYS & VCC_5V0 POWER SUPPLY.SchDoc, bottom right]

### Parts
(Parts that share a designator on the sheet are numbered #1, #2 ... from top to bottom, then left to right.)
C?#119  2.2uF  [C0603]
C?#120  2.2uF  [C0603]
C?#121  2.2uF  [C0603]
C?#122  22uF  [C0805]
C?#123  100uF  [CAP-SMD_BD6.3-L6.6-W6.6-RD]
C?#124  22uF  [C0805]
C?#125  22uF  [C0805]
C?#126  0402-100nF  [C0402]
C?#127  0402-100nF  [C0402]
C?#128  22uF  [C0805]
C?#129  100uF  [CAP-SMD_BD6.3-L6.6-W6.6-RD]
C?#130  10uF  [C0805]
C?#131  0402-33pF  [C0402]
C?#132  0402-33pF  [C0402]
C?#133  0402-0.056uF  [C0402]
C?#134  0402-0.056uF  [C0402]
C?#135  0402-1uF  [C0402]
C?#136  0402-3900pF  [C0402]
C?#137  0402-4.7pF  [C0402]
C?#138  0402-0.01uF  [C0402]
C?#139  0402-3900pF  [C0402]
C?#140  0402-4.7pF  [C0402]
C?#141  0402-4.7pF  [C0402]
D?#14  1N4148WT  [SOD-523_L1.2-W0.8-LS1.6-FD]
D??  1N4148WT  [SOD-523_L1.2-W0.8-LS1.6-FD]
L?#9  fxl0630-4r7-m  [IND-SMD_L7.0-W6.6]
L??#3  fxl0630-4r7-m  [IND-SMD_L7.0-W6.6]
Q?#3  csd18543q3a  [VSONP-8_L3.1-W3.1-P0.65-LS3.5-BL]  (value not drawn)
Q?#4  csd18543q3a  [VSONP-8_L3.1-W3.1-P0.65-LS3.5-BL]  (value not drawn)
Q??#2  csd18543q3a  [VSONP-8_L3.1-W3.1-P0.65-LS3.5-BL]  (value not drawn)
Q??#3  csd18543q3a  [VSONP-8_L3.1-W3.1-P0.65-LS3.5-BL]  (value not drawn)
R?#165  0402-2.2Ω  [R0402]
R?#166  0402-5Ω  [R0402]
R?#167  0402-5Ω  [R0402]
R?#168  0402-5Ω  [R0402]
R?#169  0402-5Ω  [R0402]
R?#170  0402-5Ω  [R0402]
R?#171  0402-0E  [R0402]
R?#172  49.9E_1%  [R0402]
R?#173  0402-5Ω  [R0402]
R?#174  0402-0E  [R0402]
R?#175  49.9E_1%  [R0402]
R?#176  0402-0E  [R0402]
R?#177  0E  [R0402]
R?#178  100K  [R0402]
R?#179  0402-20KΩ  [R0402]
R?#180  NC  [R0402]
R?#181  0E  [R0402]
R?#182  0402-100KΩ  [R0402]
R?#183  0402-20KΩ  [R0402]
R?#184  0402-10KΩ  [R0402]
U?#14  0.015E_1%  [R1206]
U??#15  lm5140qrwgtq1  [VQFN-40_L6.0-W6.0-P0.50-BL-EP]
U??#16  0.006E_1  [R1206]
U??#17  lm5140qrwgtq1  [VQFN-40_L6.0-W6.0-P0.50-BL-EP]
U??#18  mss12c02ls-bb2.0  [SW-SMD_MSS12C02LS-HB2.0-1]  (value not drawn)

### Nets
GND: C?#119.1 C?#120.1 C?#121.1 C?#122.1 C?#122.2 C?#123.1 C?#123.2 C?#124.1 C?#124.2 C?#125.1 C?#128.1 C?#129.2 C?#130.1 C?#133.2 C?#134.2 C?#135.2 C?#136.2 C?#137.2 C?#138.2 C?#139.2 C?#140.2 C?#141.2 Q?#3.5(D) Q?#3.6(D) Q?#3.7(D) Q?#3.8(D) Q?#3.9(D) Q?#4.1(S) Q?#4.2(S) Q?#4.3(S) Q??#2.5(D) Q??#2.6(D) Q??#2.7(D) Q??#2.8(D) Q??#2.9(D) Q??#3.1(S) Q??#3.2(S) Q??#3.3(S) R?#165.1 R?#178.2 R?#180.1 U??#17.14(PGND2) U??#17.17(PGND1) U??#17.35(AGND) U??#17.38(SYNIN) U??#17.41(EPAD) U??#18.1 U??#18.4  [also labelled VMAIN]
VCC_3V3_SYS: C?#125.2 C?#129.1 R?#171.2 R?#184.2 U??#16.1
VCC_5V0: C?#121.2 C?#128.2 C?#130.2 R?#176.2 U?#14.2 U??#17.6(VCCX)
VDDA_LM5140: C?#119.2 C?#120.2 D?#14.1(A) D??.1(A) R?#177.2 R?#182.2 U??#17.3(FB2) U??#17.15(VCC) U??#17.16(VCC) U??#17.28(FB1) U??#17.34(ILSET) U??#17.36(VDDA) U??#17.37(OSC)
DEMB: R?#177.1 R?#180.2 U??#17.33(DEMB)
LM5140_COMP1: C?#140.1 R?#183.2 U??#17.29(COMP1)
LM5140_COMP2: C?#137.1 R?#179.2 U??#17.2(COMP2)
TEST_POWERDOWN: R?#181.1
VCC3V3_SYS_PG: C?#141.1 R?#184.1 U??#17.24(PG1)
VCC5V0_PG: R?#182.1 U??#17.7(PG2)
VIN_MON_PORz_3V3_PG: R?#174.1
VMAIN_EN: C?#138.1 R?#173.1 R?#178.1 U??#18.2
NetC?#126_1: C?#126.1 L??#3.2 Q??#2.1(S) Q??#2.2(S) Q??#2.3(S) Q??#3.5(D) Q??#3.6(D) Q??#3.7(D) Q??#3.8(D) Q??#3.9(D) U??#17.21(SW1)
NetC?#126_2: C?#126.2 D??.2(K) U??#17.20(HB1)
NetC?#127_1: C?#127.1 L?#9.1 Q?#3.1(S) Q?#3.2(S) Q?#3.3(S) Q?#4.5(D) Q?#4.6(D) Q?#4.7(D) Q?#4.8(D) Q?#4.9(D) U??#17.10(SW2)
NetC?#127_2: C?#127.2 D?#14.2(K) U??#17.11(HB2)
NetC?#131_1: C?#131.1 R?#171.1 U??#17.26(VOUT1)
NetC?#131_2: C?#131.2 R?#172.1 U??#17.27(CS1)
NetC?#132_1: C?#132.1 R?#176.1 U??#17.5(VOUT2)
NetC?#132_2: C?#132.2 R?#175.1 U??#17.4(CS2)
NetC?#133_1: C?#133.1 U??#17.1(SS2)
NetC?#134_1: C?#134.1 U??#17.30(SS1)
NetC?#135_1: C?#135.1 U??#17.32(RES)
NetC?#136_1: C?#136.1 R?#179.1
NetC?#139_1: C?#139.1 R?#183.1
NetL?#9_2: L?#9.2 R?#175.2 U?#14.1
NetL??#3_1: L??#3.1 R?#172.2 U??#16.2
NetQ?#3_4: Q?#3.4(G) R?#167.1 U??#17.8(HOL2)
NetQ?#4_4: Q?#4.4(G) R?#169.1 R?#170.1
NetQ??#2_4: Q??#2.4(G) R?#166.1 U??#17.22(HO1)
NetQ??#3_4: Q??#3.4(G) R?#168.1 U??#17.18(LO1)
NetR?#165_2: R?#165.2 U??#17.25(VIN)
NetR?#166_2: R?#166.2 U??#17.23(HOL1)
NetR?#167_2: R?#167.2 U??#17.9(HO2)
NetR?#168_2: R?#168.2 U??#17.19(LOL1)
NetR?#169_2: R?#169.2 U??#17.13(LO2)
NetR?#170_2: R?#170.2 U??#17.12(LOL2)
NetR?#173_2: R?#173.2 U??#17.40(EN2)
NetR?#174_2: R?#174.2 U??#17.31(EN1)
NetR?#181_2: R?#181.2 U??#18.3

Not connected (* = marked no-connect by the designer): U??#15 1(SS2) 2(COMP2) 3(FB2) 4(CS2) 5(VOUT2) 6(VCCX) 7(PG2) 8(HOL2) 9(HO2) 10(SW2) 11(HB2) 12(LOL2) 13(LO2) 14(PGND2) 15(VCC) 16(VCC) 17(PGND1) 18(LO1) 19(LOL1) 20(HB1) 21(SW1) 22(HO1) 23(HOL1) 24(PG1) 25(VIN) 26(VOUT1) 27(CS1) 28(FB1) 29(COMP1) 30(SS1) 31(EN1) 32(RES) 33(DEMB) 34(ILSET) 35(AGND) 36(VDDA) 37(OSC) 38(SYNIN) 39(SYNOUT) 40(EN2) 41(EPAD); U??#17 39(SYNOUT)*

### Library data of the parts
C?#119-C?#121 = C0603: Capacitor; Value: 104; Published: 8-Jun-2000; LatestRevisionDate: 17-Jul-2002; LatestRevisionNote: Re-released for DXP Platform.; Publisher: Altium Limited
C?#122 C?#124 C?#125 C?#128 C?#130 = C0805: Capacitor; Value: 104; Published: 8-Jun-2000; LatestRevisionDate: 17-Jul-2002; LatestRevisionNote: Re-released for DXP Platform.; Publisher: Altium Limited
C?#123 C?#129 = ma35v100m6x8: 容值:100uF;精度:±20%;额定电压:35V;纹波电流:2.9A@100kHz;等效串联电阻(ESR):30mΩ@100kHz;类型:聚合物;; Manufacturer: JIERR(捷而瑞); AddInBom: yes; ModelId: 901941a22e384f799727a46cfda77174; ModelName: CAP-SMD_L6.6-W6.6-H7.0-LS7.2; ModelTransform: 307.086,259.842,0,0,0,0,0,0,0; Tolerance: ±20%; Voltage Rating: 35V; Type: 聚合物; Lifetime: 2000hrs@105℃; Polarity type: 有极性; Symbol: MA35V100M6X8; LCSC Part Name: 100uF ±20% 35V; SupplierPart: C46550467; ManufacturerPart: MA35V100M6X8; Supplier Footprint: SMD,D6.3xL7.7mm; JLCPCB Part Class: Extended Part; Datasheet: https://item.szlcsc.com/datasheet/MA35V100M6X8/48680161.html; Supplier: LCSC; ConvertToPcb: yes; FootprintName: CAP-SMD_BD6.3-L6.6-W6.6-RD; Value: 100uF; Ripple Current: 2.9A@100kHz; Equivalent Series Resistance(ESR): 30mΩ@100kHz; Diameter: 6.3mm; Height - Seated (Max): 7mm; Operating Temperature: -55℃~+105℃
C?#126 C?#127 C?#131-C?#141 = C0402: 物料号: *; 物料描述: *
D?#14 D?? = 1N4148WT: 二极管配置:独立式;整流电流:150mA;直流反向耐压(Vr):100V;正向压降(Vf):1.25V@150mA;反向恢复时间(Trr):4ns;; Manufacturer: R+O(宏嘉诚); Symbol: 1N4148WT_C7420320; AddInBom: yes; ModelId: 8f56a03db567494d8f4c9d12aa52a741; ModelName: SOD-523_L1.2-W0.8-H0.7-LS1.6; ModelTransform: 62.992,31.496,0,0,0,0,0,0,0; Diode Configuration: 独立式; Pd - Power Dissipation: 150mW; Current - Rectified: 150mA; Voltage - DC Reverse(Vr): 100V; Non-Repetitive Peak Forward Surge Current: 2A; Reverse Leakage Current (Ir): 1uA@75V; Reverse Recovery Time (trr): 4ns; Operating Junction Temperature Range: -55℃~+150℃; LCSC Part Name: 100V 150mA; SupplierPart: C7420320; ManufacturerPart: 1N4148WT; Supplier Footprint: SOD-523; JLCPCB Part Class: Extended Part; Datasheet: https://item.szlcsc.com/datasheet/1N4148WT/8397142.html; Supplier: LCSC; ConvertToPcb: yes; FootprintName: SOD-523_L1.2-W0.8-LS1.6-FD; Voltage - Forward(Vf@If): 1.25V@150mA
L?#9 L??#3 = fxl0630-4r7-m: SMD，7x6.6x2.8mm   合金电感，一体成型电感，大电流; Manufacturer: cjiang(长江微电); AddInBom: yes; ModelId: 6860c29aec394a38a0f014af7f722a42; ModelName: IND-SMD_L7.0-W6.6-H3.0; ModelTransform: 275.59,259.88137,0,0,0,0,0,0,0; Value: 4.7uH; Tolerance: ±20%; Current Rating: 6A; Current - Saturation(Isat): 9A; DC Resistance(DCR): 33mΩ; Type: 一体成型电感; Symbol: FXL0630-4R7-M; LCSC Part Name: 4.7uH ±20% 9A; SupplierPart: C167220; ManufacturerPart: FXL0630-4R7-M; Supplier Footprint: SMD,7x6.6mm; JLCPCB Part Class: Extended Part; Datasheet: https://item.szlcsc.com/datasheet/FXL0630-4R7-M/178603.html; Supplier: LCSC; ConvertToPcb: yes; FootprintName: IND-SMD_L7.0-W6.6
Q?#3 Q?#4 Q??#2 Q??#3 = csd18543q3a: 数量:1个N沟道;漏源电压(Vdss):60V;连续漏极电流(Id):60A;导通电阻(RDS(on)):8.1mΩ@10V;耗散功率(Pd):66W;阈值电压(Vgs(th)):2V;; Manufacturer: TI(德州仪器); AddInBom: yes; ModelId: 3ca62a27ecf447829a39b8428e2a4ea6; ModelName: VSON-CLIP-8_L3.1-W3.0-H0.8-P0.65; ModelTransform: 129.921,118.8974,0,0,0,0,0.497,-3.992,0; Number: 1个N沟道; Drain to Source Voltage: 60V; Current - Continuous Drain(Id): 60A; Pd - Power Dissipation: 66W; Gate Threshold Voltage (Vgs(th)): 2V; Gate Charge(Qg): 11.1nC@10V; Input Capacitance(Ciss): 885pF; Reverse Transfer Capacitance (Crss@Vds): 4.8pF; Type: N沟道; Output Capacitance(Coss): 168pF; Symbol: CSD18543Q3A; LCSC Part Name: 60V、N沟道功率MOSFET; SupplierPart: C840100; ManufacturerPart: CSD18543Q3A; Supplier Footprint: VSONP-8(3.3x3.3); JLCPCB Part Class: Extended Part; Datasheet: https://www.ti.com/cn/lit/ds/symlink/csd18543q3a.pdf; Supplier: LCSC; ConvertToPcb: yes; FootprintName: VSONP-8_L3.1-W3.1-P0.65-LS3.5-BL; RDS(on): 8.1mΩ@10V; Operating Temperature: -55℃~+150℃
R?#165-R?#184 = R0402: as R?#132 on sheet SoC POWER SUPPLY
U?#14 U??#16 = frm121wfr010tm: 电阻类型:采样电阻;阻值:10mΩ;精度:±1%;工作电压:-;功率:1W;温度系数:±50ppm/℃;安装方式:-;; Manufacturer: FOJAN(富捷); AddInBom: yes; ModelId: 89a1f13db2384da588040e0b3c55bf66; ModelName: R1206_L3.2-W1.6-H0.6; ModelTransform: 125.984,62.992,0,0,0,0,0,0,0; Value: 10mΩ; Tolerance: ±1%; Power(Watts): 1W; Symbol: FRM121WFR010TM; LCSC Part Name: 10mΩ ±1% 1W; SupplierPart: C7467248; ManufacturerPart: FRM121WFR010TM; Supplier Footprint: 1206; JLCPCB Part Class: Extended Part; Datasheet: https://item.szlcsc.com/datasheet/FRM121WFR010TM/8513848.html; Supplier: LCSC; ConvertToPcb: yes; FootprintName: R1206; Type: 采样电阻; Voltage Rating: -; Current Rating: -; Temperature Coefficient: ±50ppm/℃; Mounting Type: -
U??#15 U??#17 = lm5140qrwgtq1: 功能类型:降压型;工作电压:3.8V~65V;输出电压:1.5V~15V;输出电流:-;输出类型:可调;; Manufacturer: TI(德州仪器); AddInBom: yes; ModelId: 9abaade914744556b7a2df475e9925e7; ModelName: VQFN-40_L6.0-W6.0-H1.0-P0.50; ModelTransform: 237.007,237.007,0,90,0,0,-0.005,0.005,0; Function: 降压型; Frequency - Switching: 440kHz; Synchronous Rectifier: 是; Number of Outputs: 2; Topology: 降压式; Quiescent Current: 35uA; Switch tube (built-in/external): 外置; Output Type: 可调; Symbol: LM5140QRWGTQ1; LCSC Part Name: 降压型 3.8V~65V; SupplierPart: C201623; ManufacturerPart: LM5140QRWGTQ1; Supplier Footprint: VQFN-40-EP(6x6); JLCPCB Part Class: Extended Part; Datasheet: https://www.ti.com/cn/lit/gpn/lm5140-q1; Supplier: LCSC; ConvertToPcb: yes; FootprintName: VQFN-40_L6.0-W6.0-P0.50-BL-EP; Voltage - Supply: 3.8V~65V; Output Voltage: 1.5V~15V; Output Current: -; Operating Temperature: -40℃~+150℃@(TJ); Features: 轻载高效模式；频率同步；逐波限流；可调软启动；过流保护；工作状态指示；可调限流；打嗝限流
U??#18 = mss12c02ls-bb2.0: 电路结构:单刀双掷;安装方式:立贴;开关颜色:白色;额定电流:50mA;额定电压:12V;工作寿命:1万次;; Manufacturer: SHOU HAN(首韩); AddInBom: yes; ModelId: 7f5e09f8c3bf4d79a7a083d494104806; ModelTransform: 307.086,148.0312,0,0,0,0,0,-5.866,-19.685; Circuit: 单刀双掷; Actuator Style: 矩形柱状; Switch Height: 3.4mm; Actuator Color: 白色; Current Rating: 50mA; Voltage Rating: 12V; Life: 1万次; Symbol: MSS12C02LS-BB2.0; LCSC Part Name: MSS12C02LS-BB2.0; SupplierPart: C3008585; ManufacturerPart: MSS12C02LS-BB2.0; Supplier Footprint: SMD,6.7x2.8mm; JLCPCB Part Class: Extended Part; Datasheet: https://item.szlcsc.com/datasheet/MSS12C02LS-BB2.0/3501432.html; Supplier: LCSC; ConvertToPcb: yes; FootprintName: SW-SMD_MSS12C02LS-HB2.0-1; ModelName: SW-SMD_MSS12C02LS-HB2.0-1; Termination Style: SMD接片; Length: 6.65mm; Width: 2.75mm; Mounting Type: 立贴; Operating Temperature: -25℃~+70℃

## Nets that join several sheets
+3V3: IO_Connectors (6 pins), SDRAM，JTAG，I2C EEPROM，SD Card (19 pins), USB,TFT LCD,touchscreen,audio amplifier (5 pins), Ethernet_PHY_1 (8 pins), Ethernet_PHY_2 (8 pins), TYPE-C (R?#48.1 R?#49.1), CAN (C107.1 C?#24.1 U7.1 U?#4.1), OSPI_FLASH、EEPROM (18 pins), bootload_wifi (22 pins)
+5V: IO_Connectors (U5.18 U5.23), USB,TFT LCD,touchscreen,audio amplifier (C56.2 C57.2 L1.1 R19.2), TYPE-C (U?#2.5 U?#3.5), CAN (C103.2 C104.2 .2), SoC POWER SUPPLY (6 pins)
AVDD3V3: Ethernet_PHY_1 (5 pins), Ethernet_PHY_2 (5 pins)
AVDD10: Ethernet_PHY_1 (7 pins), Ethernet_PHY_2 (7 pins)
DDR_VREFCA: DDR4 (C?#50.1 L??#1.1 U??#4.M1), PERIPHERAL POWER SUPPLY (C?#101.1 U??#11.6)
DVDD3V3: Ethernet_PHY_1 (C118.2 C119.2 R93.1 U21.29), Ethernet_PHY_2 (C?#13.2 C?#14.2 R?#36.1 U?#1.29)
DVDD10: Ethernet_PHY_1 (C67.2 R33.1 U21.21), Ethernet_PHY_2 (C?#4.2 R?#20.1 U?#1.21)
DVDDRG: Ethernet_PHY_1 (13 pins), Ethernet_PHY_2 (13 pins)
GND: IO_Connectors (25 pins), SDRAM，JTAG，I2C EEPROM，SD Card (35 pins), USB,TFT LCD,touchscreen,audio amplifier (40 pins), Ethernet_PHY_1 (39 pins), Ethernet_PHY_2 (39 pins), TYPE-C (20 pins), CAN (7 pins), EMMC (20 pins), OSPI_FLASH、EEPROM (18 pins), BOOT_MODE_BUFFER&SWITCHES (9 pins), DDR4 (52 pins), bootload_wifi (23 pins), SoC POWER SUPPLY (45 pins), PERIPHERAL POWER SUPPLY (42 pins), VCC3V3_SYS & VCC_5V0 POWER SUPPLY (48 pins)
PE: IO_Connectors (U19.1), SDRAM，JTAG，I2C EEPROM，SD Card (TF1.10 TF1.11 TF1.12 TF1.13), Ethernet_PHY_1 (6 pins), Ethernet_PHY_2 (6 pins), TYPE-C (8 pins), CAN (C109.2 R76.2)
VCC1V2_DDR: SoC POWER SUPPLY (C?#95.2 L?#5.2 R?#146.2 U??#10.3), PERIPHERAL POWER SUPPLY (C?#106.2 L?#7.2 R?#154.2 U?#11.3)
VCC1V8: OSPI_FLASH、EEPROM (18 pins), SoC POWER SUPPLY (C?#94.2 L??#2.2 U??#9.3 U??#9.4)
VCC3V3_PREREG: SoC POWER SUPPLY (18 pins), PERIPHERAL POWER SUPPLY (R?#156.2 R?#157.2)
VCC_3V3_SYS: SDRAM，JTAG，I2C EEPROM，SD Card (7 pins), BOOT_MODE_BUFFER&SWITCHES (R?#100.2 R?#101.2 R?#102.2), PERIPHERAL POWER SUPPLY (18 pins), VCC3V3_SYS & VCC_5V0 POWER SUPPLY (5 pins)
VDD_DDR4: DDR4 (35 pins), PERIPHERAL POWER SUPPLY (C?#100.1 U??#11.1)
VDDR_VTT: DDR4 (38 pins), PERIPHERAL POWER SUPPLY (C?#99.2 U??#11.3 U??#11.5)
ETH_D0N: Ethernet_PHY_1 (D19.1 RJ1.P3 U21.1), Ethernet_PHY_2 (D?#7.1 RJ?.P3 U?#1.1)
ETH_D0P: Ethernet_PHY_1 (D23.1 RJ1.P2 U21.2), Ethernet_PHY_2 (D?#8.1 RJ?.P2 U?#1.2)
ETH_D1N: Ethernet_PHY_1 (D7.1 RJ1.P7 U21.4), Ethernet_PHY_2 (D?#2.1 RJ?.P7 U?#1.4)
ETH_D1P: Ethernet_PHY_1 (D6.1 RJ1.P4 U21.5), Ethernet_PHY_2 (D?#1.1 RJ?.P4 U?#1.5)
ETH_D2N: Ethernet_PHY_1 (D15.1 RJ1.P6 U21.6), Ethernet_PHY_2 (D?#4.1 RJ?.P6 U?#1.6)
ETH_D2P: Ethernet_PHY_1 (D14.1 RJ1.P5 U21.7), Ethernet_PHY_2 (D?#3.1 RJ?.P5 U?#1.7)
ETH_D3N: Ethernet_PHY_1 (D17.1 RJ1.P9 U21.9), Ethernet_PHY_2 (D?#6.1 RJ?.P9 U?#1.9)
ETH_D3P: Ethernet_PHY_1 (D16.1 RJ1.P8 U21.10), Ethernet_PHY_2 (D?#5.1 RJ?.P8 U?#1.10)
ETH_MCLK_125/25: Ethernet_PHY_1 (R98.1), Ethernet_PHY_2 (R?#37.1)
ETH_MDC: Ethernet_PHY_1 (U21.14), Ethernet_PHY_2 (U?#1.14)
ETH_MDIO: Ethernet_PHY_1 (R79.2 U21.13), Ethernet_PHY_2 (R?#26.2 U?#1.13)
ETH_NTB: Ethernet_PHY_1 (R37.2 U21.31), Ethernet_PHY_2 (R?#19.2 U?#1.31)
ETH_REGOUT: Ethernet_PHY_1 (C70.2 L7.1 U21.30), Ethernet_PHY_2 (C?#7.2 L?#1.1 U?#1.30)
ETH_RESET_N: Ethernet_PHY_1 (R61.2 R90.2 U21.39), Ethernet_PHY_2 (R?#23.2 R?#28.2 U?#1.39)
ETH_RX_CLK/PHYAD1: Ethernet_PHY_1 (R40.2 R45.1 RN4.8 U21.27), Ethernet_PHY_2 (R?#21.2 R?#22.1 RN?#1.8 U?#1.27)
ETH_TX_CLK: Ethernet_PHY_1 (RN6.3 U21.20), Ethernet_PHY_2 (RN?#11.3 U?#1.20)
ETH_TX_EN: Ethernet_PHY_1 (RN6.4 U21.19), Ethernet_PHY_2 (RN?#10.4 U?#1.19)
ETH_TXD0: Ethernet_PHY_1 (RN5.1 U21.18), Ethernet_PHY_2 (RN?#7.1 U?#1.18)
ETH_TXD1: Ethernet_PHY_1 (RN5.2 U21.17), Ethernet_PHY_2 (RN?#5.2 U?#1.17)
ETH_TXD2: Ethernet_PHY_1 (RN5.3 U21.16), Ethernet_PHY_2 (RN?#3.3 U?#1.16)
ETH_TXD3: Ethernet_PHY_1 (RN5.4 U21.15), Ethernet_PHY_2 (RN?#2.4 U?#1.15)
ETH_XTAL_IN: Ethernet_PHY_1 (R32.2 U21.36), Ethernet_PHY_2 (R?#15.2 U?#1.36)
ETH_XTAL_OUT: Ethernet_PHY_1 (R31.2 U21.37), Ethernet_PHY_2 (R?#14.2 U?#1.37)
I2C1_SCL: IO_Connectors (U19.6), SDRAM，JTAG，I2C EEPROM，SD Card (U10.6), USB,TFT LCD,touchscreen,audio amplifier (FPC2.3)
I2C1_SDA: IO_Connectors (U19.5), SDRAM，JTAG，I2C EEPROM，SD Card (U10.5), USB,TFT LCD,touchscreen,audio amplifier (FPC2.2)
LED0/CFG_EXT: Ethernet_PHY_1 (R91.2 R92.1 U21.32), Ethernet_PHY_2 (R?#30.2 R?#31.1 U?#1.32)
LED1/CFG_LDO0: Ethernet_PHY_1 (R27.2 R94.2 R95.1 U21.33), Ethernet_PHY_2 (R?#12.2 R?#32.2 R?#33.1 U?#1.33)
LED2/CFG_LDO: Ethernet_PHY_1 (R28.2 R96.2 R97.1 U21.34), Ethernet_PHY_2 (R?#13.2 R?#34.2 R?#35.1 U?#1.34)
MCLK_125/25: Ethernet_PHY_1 (C120.2 R98.2 U21.35), Ethernet_PHY_2 (C?#16.2 R?#37.2 U?#1.35)
PHYRSTB: Ethernet_PHY_1 (U21.12), Ethernet_PHY_2 (U?#1.12)
RESET: IO_Connectors (U5.38), SDRAM，JTAG，I2C EEPROM，SD Card (D9.1 H1.6)
RX_CLK: Ethernet_PHY_1 (RN4.1), Ethernet_PHY_2 (RN?#1.1)
RXC_N: Ethernet_PHY_1 (RN4.2), Ethernet_PHY_2 (RN?#4.2)
RXCTL/PHYAD2: Ethernet_PHY_1 (R62.2 R72.1 RN4.7 U21.26), Ethernet_PHY_2 (R?#24.2 R?#25.1 RN?#4.7 U?#1.26)
RXD0/RXDLY: Ethernet_PHY_1 (R99.2 R100.1 RN4.6 U21.25), Ethernet_PHY_2 (R?#39.2 R?#40.1 RN?#6.6 U?#1.25)
RXD0_N: Ethernet_PHY_1 (RN4.3), Ethernet_PHY_2 (RN?#6.3)
RXD1/TXDLY: Ethernet_PHY_1 (R102.2 R103.1 RN4.5 U21.24), Ethernet_PHY_2 (R?#41.2 R?#42.1 RN?#8.5 U?#1.24)
RXD1_N: Ethernet_PHY_1 (RN4.4), Ethernet_PHY_2 (RN?#8.4)
RXD2/PLLOFF: Ethernet_PHY_1 (R104.2 R105.1 RN6.8 U21.23), Ethernet_PHY_2 (R?#44.2 R?#45.1 RN?#9.8 U?#1.23)
RXD2_N: Ethernet_PHY_1 (RN6.1), Ethernet_PHY_2 (RN?#9.1)
RXD3/PHYAD0: Ethernet_PHY_1 (R34.2 R35.1 RN6.7 U21.22), Ethernet_PHY_2 (R?#17.2 R?#18.1 RN?#12.7 U?#1.22)
RXD3_N: Ethernet_PHY_1 (RN6.2), Ethernet_PHY_2 (RN?#12.2)
TX_CLK: Ethernet_PHY_1 (RN6.6), Ethernet_PHY_2 (RN?#11.6)
TXC_N: Ethernet_PHY_1 (RN6.5), Ethernet_PHY_2 (RN?#10.5)
TXD0_N: Ethernet_PHY_1 (RN5.8), Ethernet_PHY_2 (RN?#7.8)
TXD1_N: Ethernet_PHY_1 (RN5.7), Ethernet_PHY_2 (RN?#5.7)
TXD2_N: Ethernet_PHY_1 (RN5.6), Ethernet_PHY_2 (RN?#3.6)
TXD3_N: Ethernet_PHY_1 (RN5.5), Ethernet_PHY_2 (RN?#2.5)
VCC3V3_SYS_PG: SoC POWER SUPPLY (R?#142.2 R?#148.2), PERIPHERAL POWER SUPPLY (R?#164.1), VCC3V3_SYS & VCC_5V0 POWER SUPPLY (C?#141.1 R?#184.1 U??#17.24)
VCC5V0_PG: SoC POWER SUPPLY (U?#9.1), VCC3V3_SYS & VCC_5V0 POWER SUPPLY (R?#182.1 U??#17.7)
VIN_MON_PORz_3V3_PG: PERIPHERAL POWER SUPPLY (R?#158.1 R?#159.1 R?#162.1 R?#163.1), VCC3V3_SYS & VCC_5V0 POWER SUPPLY (R?#174.1)